# Altium schematic sheet MTQ_CH.SchDoc
size A4; SheetNumber: 8; SheetTotal: 9
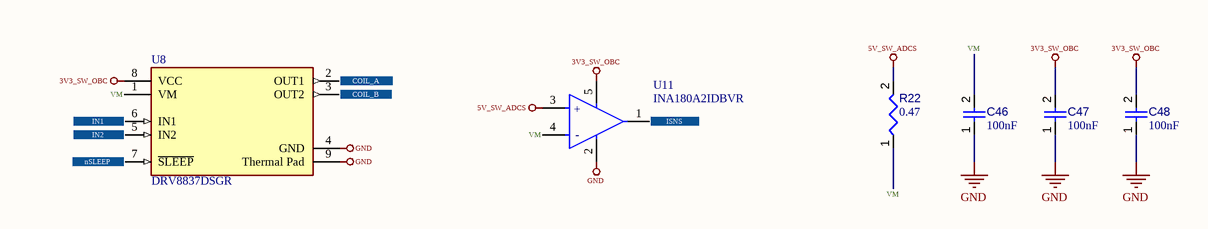
[diagram p0: MTQ_CH.SchDoc]

## Parts
C46  value 100nF  [CAPC0402(1005)60_L]  (hidden comment: Capacitor 100nF +/-20% 25V 0402)
C47  value 100nF  [CAPC0402(1005)60_L]  (hidden comment: Capacitor 100nF +/-20% 25V 0402)
C48  value 100nF  [CAPC0402(1005)60_L]  (hidden comment: Capacitor 100nF +/-20% 25V 0402)
R22  value 0.47  [RESC1608X55X25ML10T15]  (hidden comment: Resistor 4k7 +/-1% 0603 100 mW)
U8  DRV8837DSGR  [FP-DSG0008A-IPC_A]
U11  INA180A2IDBVR  [FP-DBV0005A-IPC_B]

## Ports
COIL_A (out), COIL_B (out), IN1 (out), IN2 (out), ISNS (out), nSLEEP (out)

## Nets
3V3_SW_OBC: C47.2 C48.2 U8.8(VCC) U11.5(VS)
5V_SW_ADCS: R22.2 U11.3(IN+)
GND: C46.1 C47.1 C48.1 U8.4(GND) U8.9(Thermal_Pad) U11.2(GND)
COIL_A: U8.2(OUT1) ; port COIL_A
COIL_B: U8.3(OUT2) ; port COIL_B
IN1: U8.6(IN1) ; port IN1
IN2: U8.5(IN2) ; port IN2
ISNS: U11.1(OUT) ; port ISNS
nSLEEP: U8.7(~{SLEEP}) ; port nSLEEP
VM: C46.2 R22.1 U8.1(VM) U11.4(IN-)

## Notes on the sheet
- (in symbol CMP-014-00002-1) +; -

## Library data of the parts
C46-C48 = CMP-001-00065-4: Chip Capacitor, 100nF +/-20%, 25V, 0402, Thickness 0.6 mm; Tolerance: 10%; Max Operating Temperature: 85°C; Min Operating Temperature: -55°C; Pins: 2; Voltage Rating: 25V; Mounting Technology: SMT; Case/Package: 0402
R22 = CMP-009-00031-5: Chip Resistor, 4.7 KOhm, +/- 1%, 0.1 W, -55 to 155 degC, 0603 (1608 Metric); Power: 100mW; Tolerance: 1%; Mounting Technology: SM; Case/Package: 0603; RoHS Compliant: True; Pins: 2; Min Operating Temperature: -55°C; Max Operating Temperature: 155°C
U8 = CMP-00024-00006-1: 12-V, 1.8-A H-bridge motor driver 8-WSON -40 to 85; Manufacturer Lifecycle Status: ACTIVE; Max Output current: 1.8A; Motor Type: Brushed; Number of Outputs: 2; Number of Channels: 1; Nominal Supply Current: 300µA; Fault Protection: Over Temperature, Short Circuit; Max Supply Voltage: 7V; Max Junction Temperature (Tj): 150°C; Min Supply Voltage: 1.8V; Pins: 8; Thickness: 750µm; Mounting Technology: Surface Mount; Min Operating Temperature: -40°C; Type: Integrated Circuit (IC); Schedule B: 8542390000, 8542390000; REACH SVHC: Unaffected; Height: 800µm; RoHS: Compliant; Output Current: 1.8A; Length: 2mm; Ambient Temperature Range High: 85°C; Lifecycle Status: Production; Lead Free: Lead Free; Max Operating Temperature: 85°C; Radiation Hardening: No; Width: 2mm
U11 = CMP-014-00002-1: IC CURR SENSE 1 CIRCUIT SOT23-5 / Current Sense Amplifier 1 Circuit Rail-to-Rail SOT-23-5; Manufacturer Lifecycle Status: ACTIVE; Nominal Supply Current: 197µA; Number of Channels: 1; Max Junction Temperature (Tj): 150°C; Input Bias Current: 80µA; Input Offset Voltage (Vos): 100µV; Bandwidth: 210kHz; Max Supply Voltage: 5.5V; Min Supply Voltage: 2.7V; Output Current per Channel: 8mA; Min Operating Temperature: -40°C; Width: 1.6mm; Thickness: 1.2mm; Schedule B: 8542330000, 8542330000; Height: 1.45mm; Case/Package: SOT-23; Ambient Temperature Range High: 125°C; RoHS: Compliant; Pins: 5; Lifecycle Status: Production; Length: 2.9mm; Max Operating Temperature: 125°C